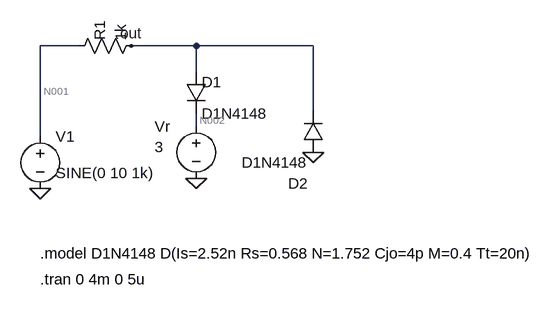
[diagram p0: schematic Ex09.asc]
Ex09.asc, the LTspice schematic file:
Version 4
SHEET 1 880 680
WIRE 60 200 60 60
WIRE 60 60 120 60
WIRE 200 60 300 60
WIRE 300 60 480 60
WIRE 300 60 300 100
WIRE 300 164 300 184
WIRE 480 60 480 160
FLAG 200 60 out
FLAG 60 280 0
FLAG 300 264 0
FLAG 480 224 0
SYMBOL voltage 60 184 R0
WINDOW 0 24 16 Left 2
WINDOW 3 24 72 Left 2
SYMATTR InstName V1
SYMATTR Value SINE(0 10 1k)
SYMBOL res 104 76 R270
WINDOW 0 24 48 Left 2
WINDOW 3 24 80 Left 2
SYMATTR InstName R1
SYMATTR Value 1k
SYMBOL diode 284 100 R0
WINDOW 0 24 16 Left 2
WINDOW 3 24 64 Left 2
SYMATTR InstName D1
SYMATTR Value D1N4148
SYMBOL voltage 300 168 R0
WINDOW 0 -64 16 Left 2
WINDOW 3 -64 48 Left 2
SYMATTR InstName Vr
SYMATTR Value 3
SYMBOL diode 496 224 R180
WINDOW 0 24 -48 Left 2
WINDOW 3 24 -16 Left 2
SYMATTR InstName D2
SYMATTR Value D1N4148
TEXT 60 380 Left 2 !.model D1N4148 D(Is=2.52n Rs=0.568 N=1.752 Cjo=4p M=0.4 Tt=20n)
TEXT 60 420 Left 2 !.tran 0 4m 0 5u

The netlist it stands for:
* Ex09.asc
V1 N001 0 SINE(0 10 1k)
R1 N001 out 1k
D1 out N002 D1N4148
Vr N002 0 3
D2 0 out D1N4148
.model D D
.lib standard.dio
.model D1N4148 D(Is=2.52n Rs=0.568 N=1.752 Cjo=4p M=0.4 Tt=20n)
.tran 0 4m 0 5u
.backanno
.end

* Results of the author's LTspice run, read from the files saved beside the schematic
* Operating Point, zero values left out:
*   V(n002) = 3 V
*   V(out) = 2.523 µV
*   I(D1) = -2.523 nA
*   I(R1) = -2.523 nA
*   I(V1) = 2.523 nA
*   I(Vr) = -2.523 nA
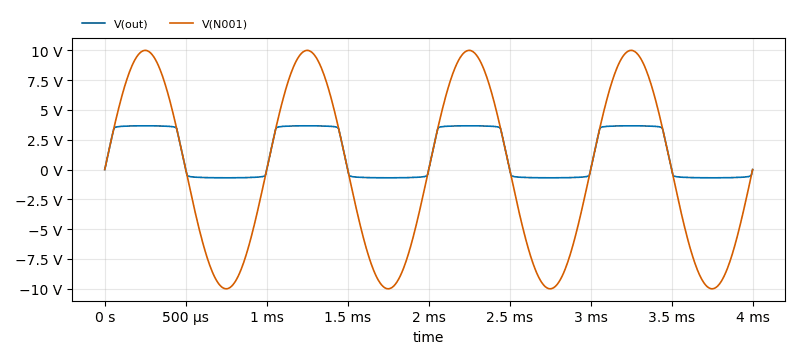
[diagram p1: Transient Analysis of Ex09.asc, plotted from the saved traces]
* Transient Analysis, 1 run:
*   V(out): min -690.6 mV, max 3.671 V, average 1.285 V, rms 2.408 V, last -575.7 µV
*   V(N001): min -10 V, max 10 V, average 3.63 µV, rms 7.071 V, last 0 V